# Altium schematic sheet Lab_7.SchDoc
size A; SheetNumber: 2; SheetTotal: 3
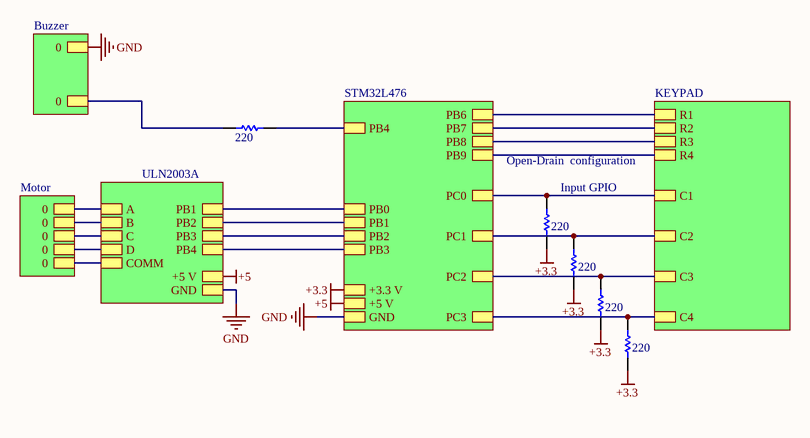
[diagram p0: Lab_7.SchDoc]

## Parts
(Parts that share a designator on the sheet are numbered #1, #2 ... from top to bottom, then left to right.)
?#1  value 220  (hidden comment: Resistor)
?#2  value 220  (hidden comment: Resistor)
?#3  value 220  (hidden comment: Resistor)
?#4  value 220  (hidden comment: Resistor)
?#5  value 220  (hidden comment: Resistor)

## Sub-sheets
Buzzer = File Name: 0, 0
KEYPAD = File Name: R1, R2, R3, R4, C1, C2, C3, C4
Motor = File Name: 0, 0, 0, 0, 0
STM32L476 = File Name: PB0, PB1, PB2, PB3, PB4, PB6, PB7, PB8, PB9, PC0, PC1, PC2, PC3, +3.3 V, +5 V, GND
ULN2003A = File Name: PB1, PB2, PB3, PB4, A, B, C, D, COMM, +5 V, GND

## Nets
+3.3: ?#2.1 ?#3.1 ?#4.1 ?#5.1 ; sheet STM32L476/+3.3 V
+5: sheet STM32L476/+5 V, sheet ULN2003A/+5 V
GND: sheet STM32L476/GND, sheet Buzzer/0, sheet ULN2003A/GND
Net?#1_1: ?#1.1 ; sheet STM32L476/PB4
Net?#1_2: ?#1.2 ; sheet Buzzer/0
Net?#2_2: ?#2.2 ; sheet STM32L476/PC0, sheet KEYPAD/C1
Net?#3_2: ?#3.2 ; sheet STM32L476/PC1, sheet KEYPAD/C2
Net?#4_2: ?#4.2 ; sheet STM32L476/PC2, sheet KEYPAD/C3
Net?#5_2: ?#5.2 ; sheet STM32L476/PC3, sheet KEYPAD/C4
(unnamed): sheet STM32L476/PB0, sheet ULN2003A/PB1
(unnamed): sheet STM32L476/PB1, sheet ULN2003A/PB2
(unnamed): sheet STM32L476/PB2, sheet ULN2003A/PB3
(unnamed): sheet STM32L476/PB3, sheet ULN2003A/PB4
(unnamed): sheet STM32L476/PB6, sheet KEYPAD/R1
(unnamed): sheet STM32L476/PB7, sheet KEYPAD/R2
(unnamed): sheet STM32L476/PB8, sheet KEYPAD/R3
(unnamed): sheet STM32L476/PB9, sheet KEYPAD/R4
(unnamed): sheet ULN2003A/A, sheet Motor/0
(unnamed): sheet ULN2003A/B, sheet Motor/0
(unnamed): sheet ULN2003A/C, sheet Motor/0
(unnamed): sheet ULN2003A/D, sheet Motor/0
(unnamed): sheet ULN2003A/COMM, sheet Motor/0

## Notes on the sheet
- (near ?#2) Open-Drain  configuration
- (near ?#2) Input GPIO

## Library data of the parts
?#1-?#5 = Resistor: TC1: 0; SimulationGenericComponent: True; TC2: 0